# Altium schematic sheet CubePilot and Motor Drivers.SchDoc
size A; SheetNumber: 3; SheetTotal: 5
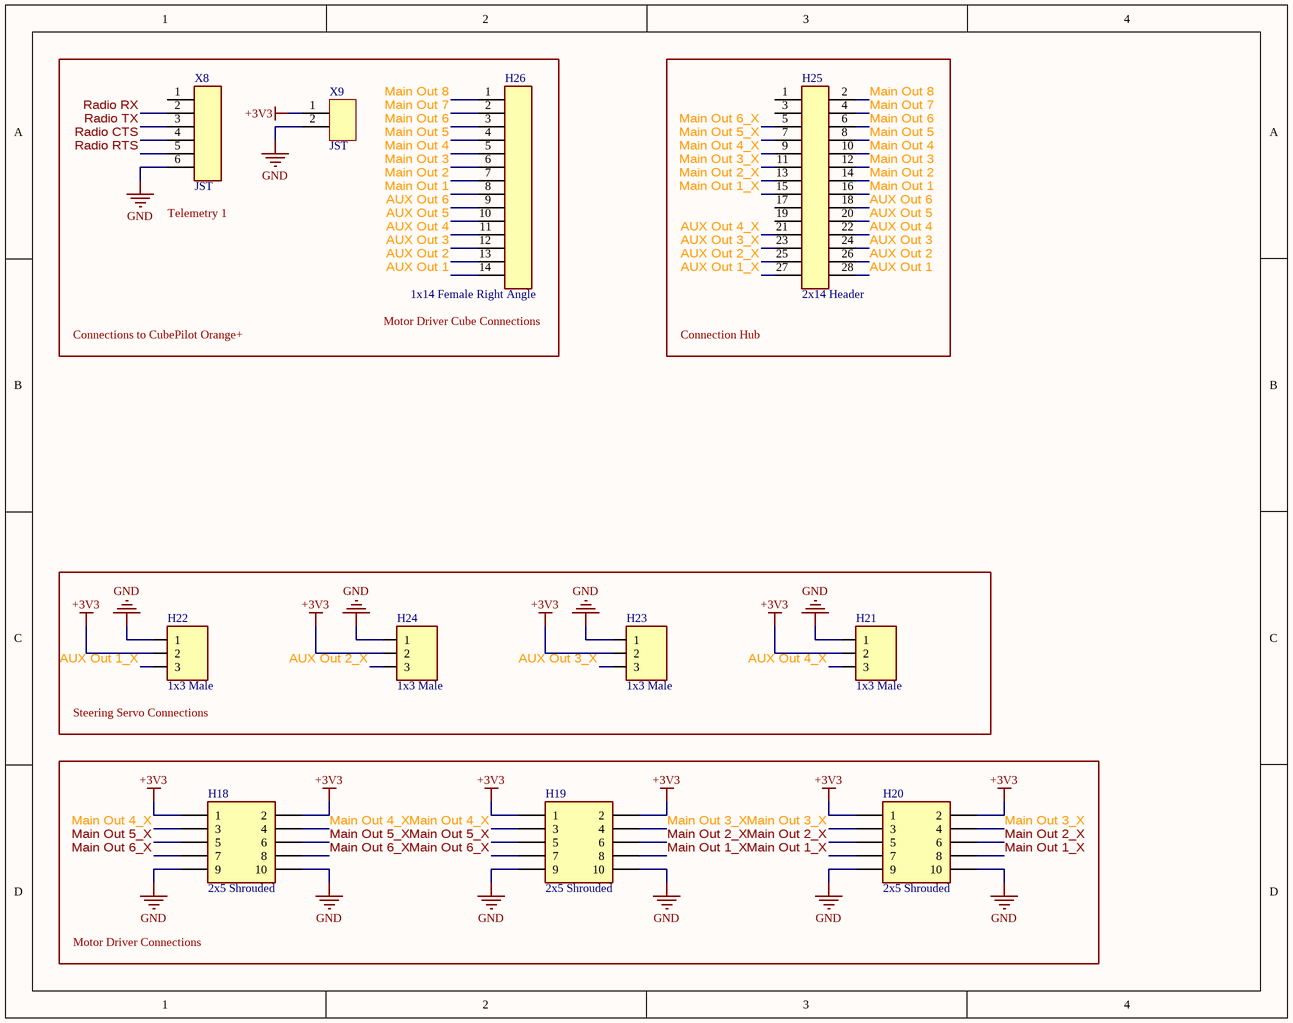
[diagram p0: CubePilot and Motor Drivers.SchDoc]

## Parts
H18  2x5 Shrouded  [[Header] Shrouded 2x5 Male]
H19  2x5 Shrouded  [[Header] Shrouded 2x5 Male]
H20  2x5 Shrouded  [[Header] Shrouded 2x5 Male]
H21  1x3 Male  [[Header] Shrouded 1x3 Male]
H22  1x3 Male  [[Header] Shrouded 1x3 Male]
H23  1x3 Male  [[Header] Shrouded 1x3 Male]
H24  1x3 Male  [[Header] Shrouded 1x3 Male]
H25  2x14 Header  [[Header] 2x14 Male]
H26  1x14 Female Right Angle  [[Header] 1x14 Right Angle Female]
X8  JST  [[JST] 6pin 2.54mm]
X9  JST  [[JST] 2PIN 2.54mm]

## Blocks framed on the sheet
Connection Hub: H25
Steering Servo Connections: H21-H24
Motor Driver Connections: H18-H20

## Nets
+3V3: H18.1 H18.2 H19.1 H19.2 H20.1 H20.2 H21.2 H22.2 H23.2 H24.2 X9.1
GND: H18.9 H18.10 H19.9 H19.10 H20.9 H20.10 H21.1 H22.1 H23.1 H24.1 X8.6 X9.2
AUX Out 1: H25.28 H26.14
AUX Out 1_X: H22.3 H25.27
AUX Out 2: H25.26 H26.13
AUX Out 2_X: H24.3 H25.25
AUX Out 3: H25.24 H26.12
AUX Out 3_X: H23.3 H25.23
AUX Out 4: H25.22 H26.11
AUX Out 4_X: H21.3 H25.21
AUX Out 5: H25.20 H26.10
AUX Out 6: H25.18 H26.9
Main Out 1: H25.16 H26.8
Main Out 1_X: H19.8 H20.7 H20.8 H25.15
Main Out 2: H25.14 H26.7
Main Out 2_X: H19.6 H20.5 H20.6 H25.13
Main Out 3: H25.12 H26.6
Main Out 3_X: H19.4 H20.3 H20.4 H25.11
Main Out 4: H25.10 H26.5
Main Out 4_X: H18.3 H18.4 H19.3 H25.9
Main Out 5: H25.8 H26.4
Main Out 5_X: H18.5 H18.6 H19.5 H25.7
Main Out 6: H25.6 H26.3
Main Out 6_X: H18.7 H18.8 H19.7 H25.5
Main Out 7: H25.4 H26.2
Main Out 8: H25.2 H26.1
Radio CTS: X8.4
Radio RTS: X8.5
Radio RX: X8.2
Radio TX: X8.3

Not connected (* = marked no-connect by the designer): H25 1 3 17 19; X8 1

## Notes on the sheet
- (near X8) Telemetry 1
- Connections to CubePilot Orange+
- (near H26) Motor Driver Cube Connections

## Library data of the parts
H18-H20 = [Header] Shrouded 2x5 Male: BHR-10-VUA
H21-H24 = [Header] Shrouded 1x3 Male: 070543-0037 / Mates with 005057-9403; Supplier 1: DigiKey; Supplier Part Number 1: WM4825-ND
H25 = [Header] 2x14 Male: 2.54mm pitch
H26 = [Header] 1x14 Right Angle Female: 2.54mm pitch
X8 = [JST] 6pin 2.54mm: 2.54mm pitch
X9 = [JST] 2pin 2.54mm: 2.54mm pitch